# Altium schematic sheet 02 MCU.SchDoc
size A4; SheetNumber: 2; SheetTotal: 4
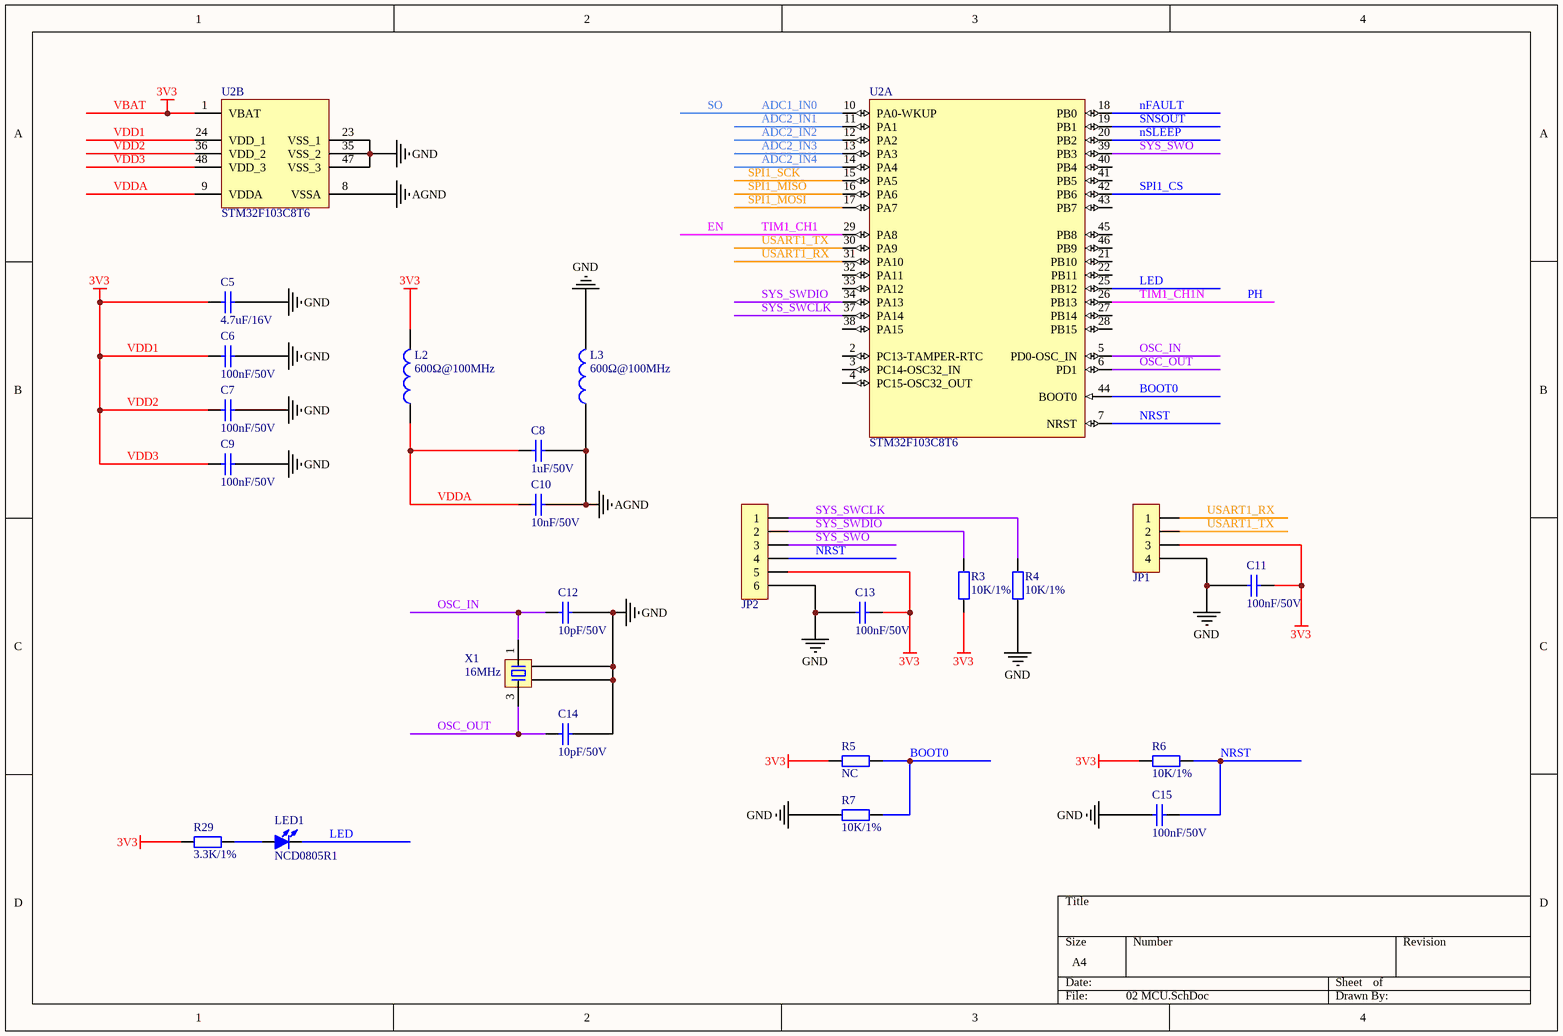
[diagram p0: 02 MCU.SchDoc]

## Parts
C5  4.7uF/16V  [C0603_L]
C6  100nF/50V  [C0603_L]
C7  100nF/50V  [C0603_L]
C8  1uF/50V  [C0603_L]
C9  100nF/50V  [C0603_L]
C10  10nF/50V  [C0603_L]
C11  100nF/50V  [C0603_L]
C12  10pF/50V  [C0603_L]
C13  100nF/50V  [C0603_L]
C14  10pF/50V  [C0603_L]
C15  100nF/50V  [C0603_L]
JP1  ZX-MX1.25-4PZZ  [MX1.25-LI-4P]  (value not drawn)
JP2  ZX-MX1.25-6PZZ  [MX1.25-LI-6P]  (value not drawn)
L2  600Ω@100MHz  [L0603]
L3  600Ω@100MHz  [L0603]
LED1  NCD0805R1  [LED0805_R]
R3  10K/1%  [R0603_L]
R4  10K/1%  [R0603_L]
R5  NC  [R0603_L]
R6  10K/1%  [R0603_L]
R7  10K/1%  [R0603_L]
R29  3.3K/1%  [R0603_L]
U2  STM32F103C8T6  [LQFP48_N]  (parts A,B of 2)
X1  16MHz  [XTAL-3225-4P]

## Nets
AGND: C8.1 C10.1 L3.1 U2.8(VSSA)
GND: C5.1 C6.1 C7.1 C9.1 C11.2 C12.1 C13.2 C14.1 C15.2 JP1.4 JP2.6 L3.2 R4.1 R7.2 U2.23(VSS_1) U2.35(VSS_2) U2.47(VSS_3) X1.2 X1.4
VBAT: C5.2 C6.2 C7.2 C9.2 C11.1 C13.1 JP1.3 JP2.5 L2.2 R3.1 R5.2 R6.2 R29.2 U2.1(VBAT) U2.24(VDD_1) U2.36(VDD_2) U2.48(VDD_3)  [also labelled 3V3, VDD1, VDD2, VDD3]
ADC1_IN0: U2.10(PA0-WKUP)  [also labelled SO]
ADC2_IN1: U2.11(PA1)
ADC2_IN2: U2.12(PA2)
ADC2_IN3: U2.13(PA3)
ADC2_IN4: U2.14(PA4)
BOOT0: R5.1 R7.1 U2.44(BOOT0)
EN: U2.29(PA8)  [also labelled TIM1_CH1]
LED: LED1.2(K) U2.25(PB12)
nFAULT: U2.18(PB0)
NRST: C15.1 JP2.4 R6.1 U2.7(NRST)
nSLEEP: U2.20(PB2)
OSC_IN: C12.2 U2.5(PD0-OSC_IN) X1.1
OSC_OUT: C14.2 U2.6(PD1) X1.3
PH: U2.26(PB13)  [also labelled TIM1_CH1N]
SNSOUT: U2.19(PB1)
SPI1_CS: U2.42(PB6)
SPI1_MISO: U2.16(PA6)
SPI1_MOSI: U2.17(PA7)
SPI1_SCK: U2.15(PA5)
SYS_SWCLK: JP2.1 R4.2 U2.37(PA14)
SYS_SWDIO: JP2.2 R3.2 U2.34(PA13)
SYS_SWO: JP2.3 U2.39(PB3)
USART1_RX: JP1.1 U2.31(PA10)
USART1_TX: JP1.2 U2.30(PA9)
VDDA: C8.2 C10.2 L2.1 U2.9(VDDA)
NetLED1_1: LED1.1(A) R29.1

Not connected (* = marked no-connect by the designer): U2 2(PC13-TAMPER-RTC) 3(PC14-OSC32_IN) 4(PC15-OSC32_OUT) 21(PB10) 22(PB11) 27(PB14) 28(PB15) 32(PA11) 33(PA12) 38(PA15) 40(PB4) 41(PB5) 43(PB7) 45(PB8) 46(PB9)

## Library data of the parts
C5 = C: CL10A475KO8NNNC; BOM名称: 无极性贴片电容; 联系卖家，免费查找封装: 唯一出售店铺网址https://shop463601444.taobao.com
C6 C7 C9 C11 C13 C15 = C: CC0603KRX7R9BB104; BOM名称: 无极性贴片电容; 联系卖家，免费查找封装: 唯一出售店铺网址https://shop463601444.taobao.com
C8 = C: CL10A105KB8NNNC; BOM名称: 无极性贴片电容; 联系卖家，免费查找封装: 唯一出售店铺网址https://shop463601444.taobao.com
C10 = C: 0603B103K500NT; BOM名称: 无极性贴片电容; 联系卖家，免费查找封装: 唯一出售店铺网址https://shop463601444.taobao.com
C12 C14 = C: CL10C100JB8NNNC; BOM名称: 无极性贴片电容; 联系卖家，免费查找封装: 唯一出售店铺网址https://shop463601444.taobao.com
JP1 = Header 4: BOM名称: 4P连接器; 联系卖家，免费技术支持: 唯一出售店铺网址https://shop463601444.taobao.com; 联系卖家 免费技术支持: 封装库来自淘宝卖家ID：黄晶宝石
JP2 = Header 6: BOM名称: 6P连接器; 联系卖家，免费技术支持: 唯一出售店铺网址https://shop463601444.taobao.com; 联系卖家 免费技术支持: 封装库来自淘宝卖家ID：黄晶宝石
L2 L3 = L: GZ1608D601TF; BOM名称: 小功率贴片电感; 联系卖家，免费查找封装: 唯一出售店铺网址https://shop463601444.taobao.com
LED1 = LED-SMD: BOM名称: 贴片LED; 联系卖家 免费查找封装: 封装库来自淘宝卖家ID：黄晶宝石
R3-R7 = R: 0603WAF1002T5E; BOM名称: 贴片电阻; 联系卖家，免费查找封装: 唯一出售店铺网址https://shop463601444.taobao.com
R29 = R: 0603WAF3301T5E; BOM名称: 贴片电阻; 联系卖家，免费查找封装: 唯一出售店铺网址https://shop463601444.taobao.com
U2 = STM32F103C8T6: STM32 ARM-based 32-bit MCU Performance Line with 64 kB Flash, 20 kB Internal RAM, -40 to +85癈 Temperature, 48-Pin LQFP, Tray; 联系卖家，免费查找封装: 唯一出售店铺网址https://shop463601444.taobao.com; DatasheetVersion: rev13.0, Apr-2011; PackageVersion: rev13, Apr-2011; PackageReference: LQFP48; PackageDescription: 48-Pin Low-Profile Quad Flat Pack, 7 x 7 mm Body, 0.5 mm Pitch (LQFP48); ComponentLink1Description: Manufacturer URL; ComponentLink1URL: http://www.st.com/; ComponentLink2Description: STM32F103 Datasheet; ComponentLink2URL: http://www.st.com/internet/com/TECHNICAL_RESOURCES/TECHNICAL_LITERATURE/DATASHEET/CD00161566.pdf; ComponentLink3Description: STM32 Family Web Page; ComponentLink3URL: www.st.com/stm32
X1 = XTAL-4P: X322516MLB4SI; BOM名称: 4脚无源晶振(谐振器）; 联系卖家，免费查找封装: 唯一出售店铺网址https://shop463601444.taobao.com